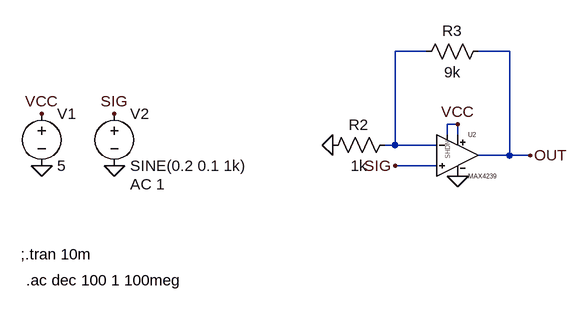
[diagram p0: schematic max4239.asc]
max4239.asc, the LTspice schematic file:
Version 4
SHEET 1 880 680
WIRE 176 16 128 16
WIRE 304 16 256 16
WIRE 224 128 208 128
WIRE 208 144 208 128
WIRE 224 144 224 128
WIRE 128 160 128 16
WIRE 128 160 112 160
WIRE 192 160 128 160
WIRE 304 176 304 16
WIRE 304 176 256 176
WIRE 336 176 304 176
WIRE 192 192 128 192
FLAG -416 192 0
FLAG -416 112 VCC
FLAG 224 128 VCC
FLAG -304 192 0
FLAG -304 112 SIG
FLAG 336 176 OUT
FLAG 128 192 SIG
FLAG 224 208 0
FLAG 32 160 0
SYMBOL voltage -416 96 R0
WINDOW 123 0 0 Left 0
WINDOW 39 0 0 Left 0
SYMATTR InstName V1
SYMATTR Value 5
SYMBOL voltage -304 96 R0
WINDOW 123 24 124 Left 2
WINDOW 39 0 0 Left 0
SYMATTR Value2 AC 1
SYMATTR InstName V2
SYMATTR Value SINE(0.2 0.1 1k)
SYMBOL res 128 144 R90
WINDOW 0 0 56 VBottom 2
WINDOW 3 32 56 VTop 2
SYMATTR InstName R2
SYMATTR Value 1k
SYMBOL res 272 0 R90
WINDOW 0 0 56 VBottom 2
WINDOW 3 32 56 VTop 2
SYMATTR InstName R3
SYMATTR Value 9k
SYMBOL MAX4239 224 112 R0
SYMATTR InstName U2
TEXT -448 328 Left 2 !;.tran 10m
TEXT -440 368 Left 2 !.ac dec 100 1 100meg

The netlist it stands for:
* max4239.asc
V1 VCC 0 5
V2 SIG 0 SINE(0.2 0.1 1k) AC 1
R2 N001 0 1k
R3 OUT N001 9k
XU2 VCC N001 SIG 0 OUT VCC MAX4239  ; pins SHDN IN- IN+ GND OUT VCC
;.tran 10m
.ac dec 100 1 100meg
.lib MAX4239.lib
.backanno
.end